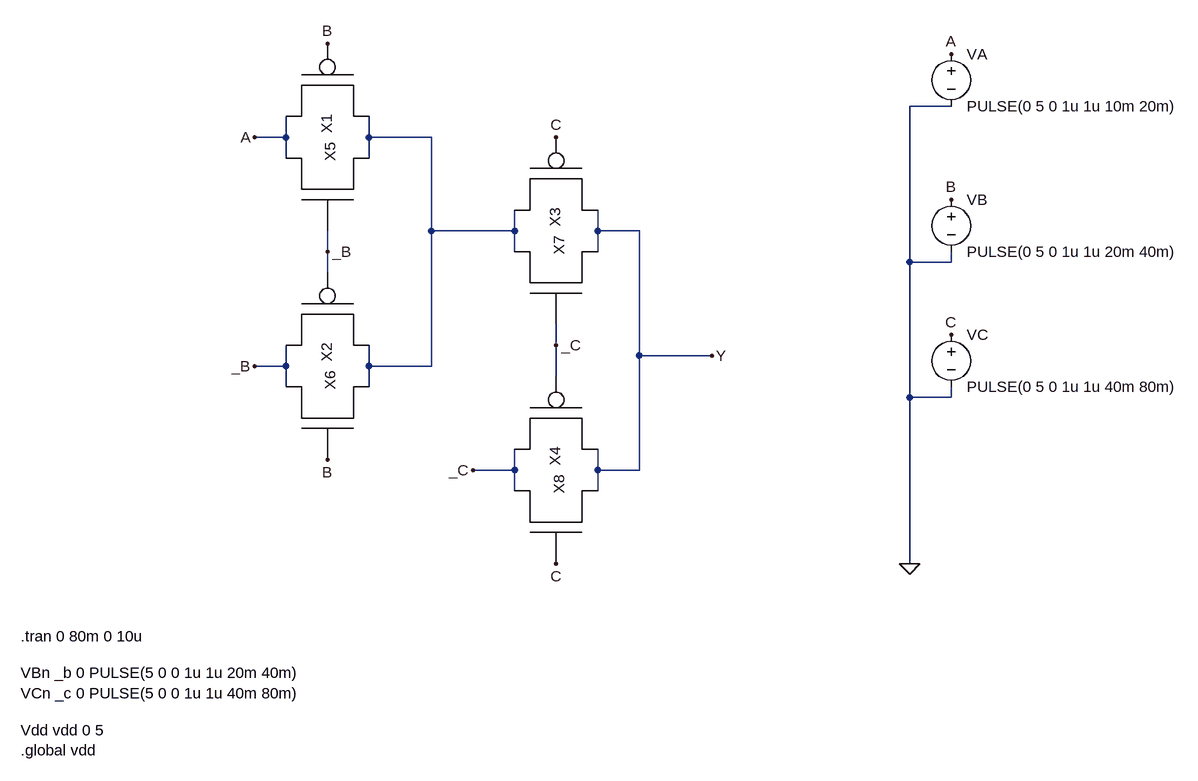
[diagram p0: schematic Draft1.asc]
Draft1.asc, the LTspice schematic file:
Version 4.1
SHEET 1 1496 780
WIRE 1088 -224 1024 -224
WIRE 64 -176 64 -208
WIRE 64 -176 16 -176
WIRE 192 -176 192 -208
WIRE 288 -176 192 -176
WIRE 64 -144 64 -176
WIRE 192 -144 192 -176
WIRE 288 -32 288 -176
WIRE 416 -32 416 -64
WIRE 416 -32 288 -32
WIRE 544 -32 544 -64
WIRE 608 -32 544 -32
WIRE 128 0 128 -32
WIRE 416 0 416 -32
WIRE 544 0 544 -32
WIRE 1024 16 1024 -224
WIRE 1088 16 1088 0
WIRE 1088 16 1024 16
WIRE 128 32 128 0
WIRE 480 144 480 112
WIRE 608 160 608 -32
WIRE 720 160 608 160
WIRE 64 176 64 144
WIRE 64 176 16 176
WIRE 192 176 192 144
WIRE 288 176 288 -32
WIRE 288 176 192 176
WIRE 480 192 480 144
WIRE 64 208 64 176
WIRE 192 208 192 176
WIRE 1024 224 1024 16
WIRE 1088 224 1088 208
WIRE 1088 224 1024 224
WIRE 416 336 416 304
WIRE 416 336 352 336
WIRE 544 336 544 304
WIRE 608 336 608 160
WIRE 608 336 544 336
WIRE 416 368 416 336
WIRE 544 368 544 336
WIRE 1024 480 1024 224
FLAG 16 -176 A
FLAG 128 -320 B
FLAG 128 320 B
FLAG 128 0 _B
FLAG 16 176 _B
FLAG 480 -176 C
FLAG 480 480 C
FLAG 480 144 _C
FLAG 352 336 _C
FLAG 720 160 Y
FLAG 1024 480 0
FLAG 1088 -304 A
FLAG 1088 -80 B
FLAG 1088 128 C
SYMBOL PMOSX 144 -240 R90
SYMATTR InstName X1
SYMBOL PMOSX 144 112 R90
SYMATTR InstName X2
SYMBOL PMOSX 496 -96 R90
SYMATTR InstName X3
SYMBOL PMOSX 496 272 R90
SYMATTR InstName X4
SYMBOL NMOSX 112 -112 R270
SYMATTR InstName X5
SYMBOL NMOSX 112 240 R270
SYMATTR InstName X6
SYMBOL NMOSX 464 32 R270
SYMATTR InstName X7
SYMBOL NMOSX 464 400 R270
SYMATTR InstName X8
SYMBOL voltage 1088 -320 R0
WINDOW 123 24 44 Left 2
WINDOW 39 0 0 Left 0
SYMATTR InstName VA
SYMATTR Value PULSE(0 5 0 1u 1u 10m 20m)
SYMBOL voltage 1088 -96 R0
WINDOW 123 24 44 Left 2
WINDOW 39 0 0 Left 0
SYMATTR InstName VB
SYMATTR Value PULSE(0 5 0 1u 1u 20m 40m)
SYMBOL voltage 1088 112 R0
WINDOW 123 24 124 Left 2
WINDOW 39 0 0 Left 0
SYMATTR InstName VC
SYMATTR Value PULSE(0 5 0 1u 1u 40m 80m)
TEXT -344 592 Left 2 !.tran 0 80m 0 10u
TEXT -344 648 Left 2 !VBn _b 0 PULSE(5 0 0 1u 1u 20m 40m)\nVCn _c 0 PULSE(5 0 0 1u 1u 40m 80m)
TEXT -344 736 Left 2 !Vdd vdd 0 5\n.global vdd

The netlist it stands for:
* Draft1.asc
X§X1 A B N001 PMOSX  ; pins D G S
X§X2 _B _B N001 PMOSX  ; pins D G S
X§X3 N001 C Y PMOSX  ; pins D G S
X§X4 _C _C Y PMOSX  ; pins D G S
X§X5 A _B N001 NMOSX  ; pins D G S
X§X6 _B B N001 NMOSX  ; pins D G S
X§X7 N001 _C Y NMOSX  ; pins D G S
X§X8 _C C Y NMOSX  ; pins D G S
VA A 0 PULSE(0 5 0 1u 1u 10m 20m)
VB B 0 PULSE(0 5 0 1u 1u 20m 40m)
VC C 0 PULSE(0 5 0 1u 1u 40m 80m)
.tran 0 80m 0 10u
VBn _b 0 PULSE(5 0 0 1u 1u 20m 40m)
VCn _c 0 PULSE(5 0 0 1u 1u 40m 80m)
Vdd vdd 0 5
.global vdd
.lib MOS4007.txt
.backanno
.end